# Altium project BMS-v1.1.PrjPcb (part 2 of 3)

## Sheet BMS-Controller-Sheet.SchDoc: Title
size 420 x 297 mm; Date: *******; ApprovedBy: *******; CheckedBy: None; Author: *******; CompanyName: *******; DrawnBy: Name; Engineer: *******; Organization: *******; Address1: *******; Address2: *******; Address3: *******; Address4: *******; DocumentNumber: Doc Num; Revision: *******; SheetNumber: 4; SheetTotal: 4; CurrentTime: *******; CurrentDate: *******; Time: *******; DocumentFullPathAndName: *******; DocumentName: *******; ModifiedDate: *******; ImagePath: *******; ProjectName: *******; Application_BuildNumber: *******
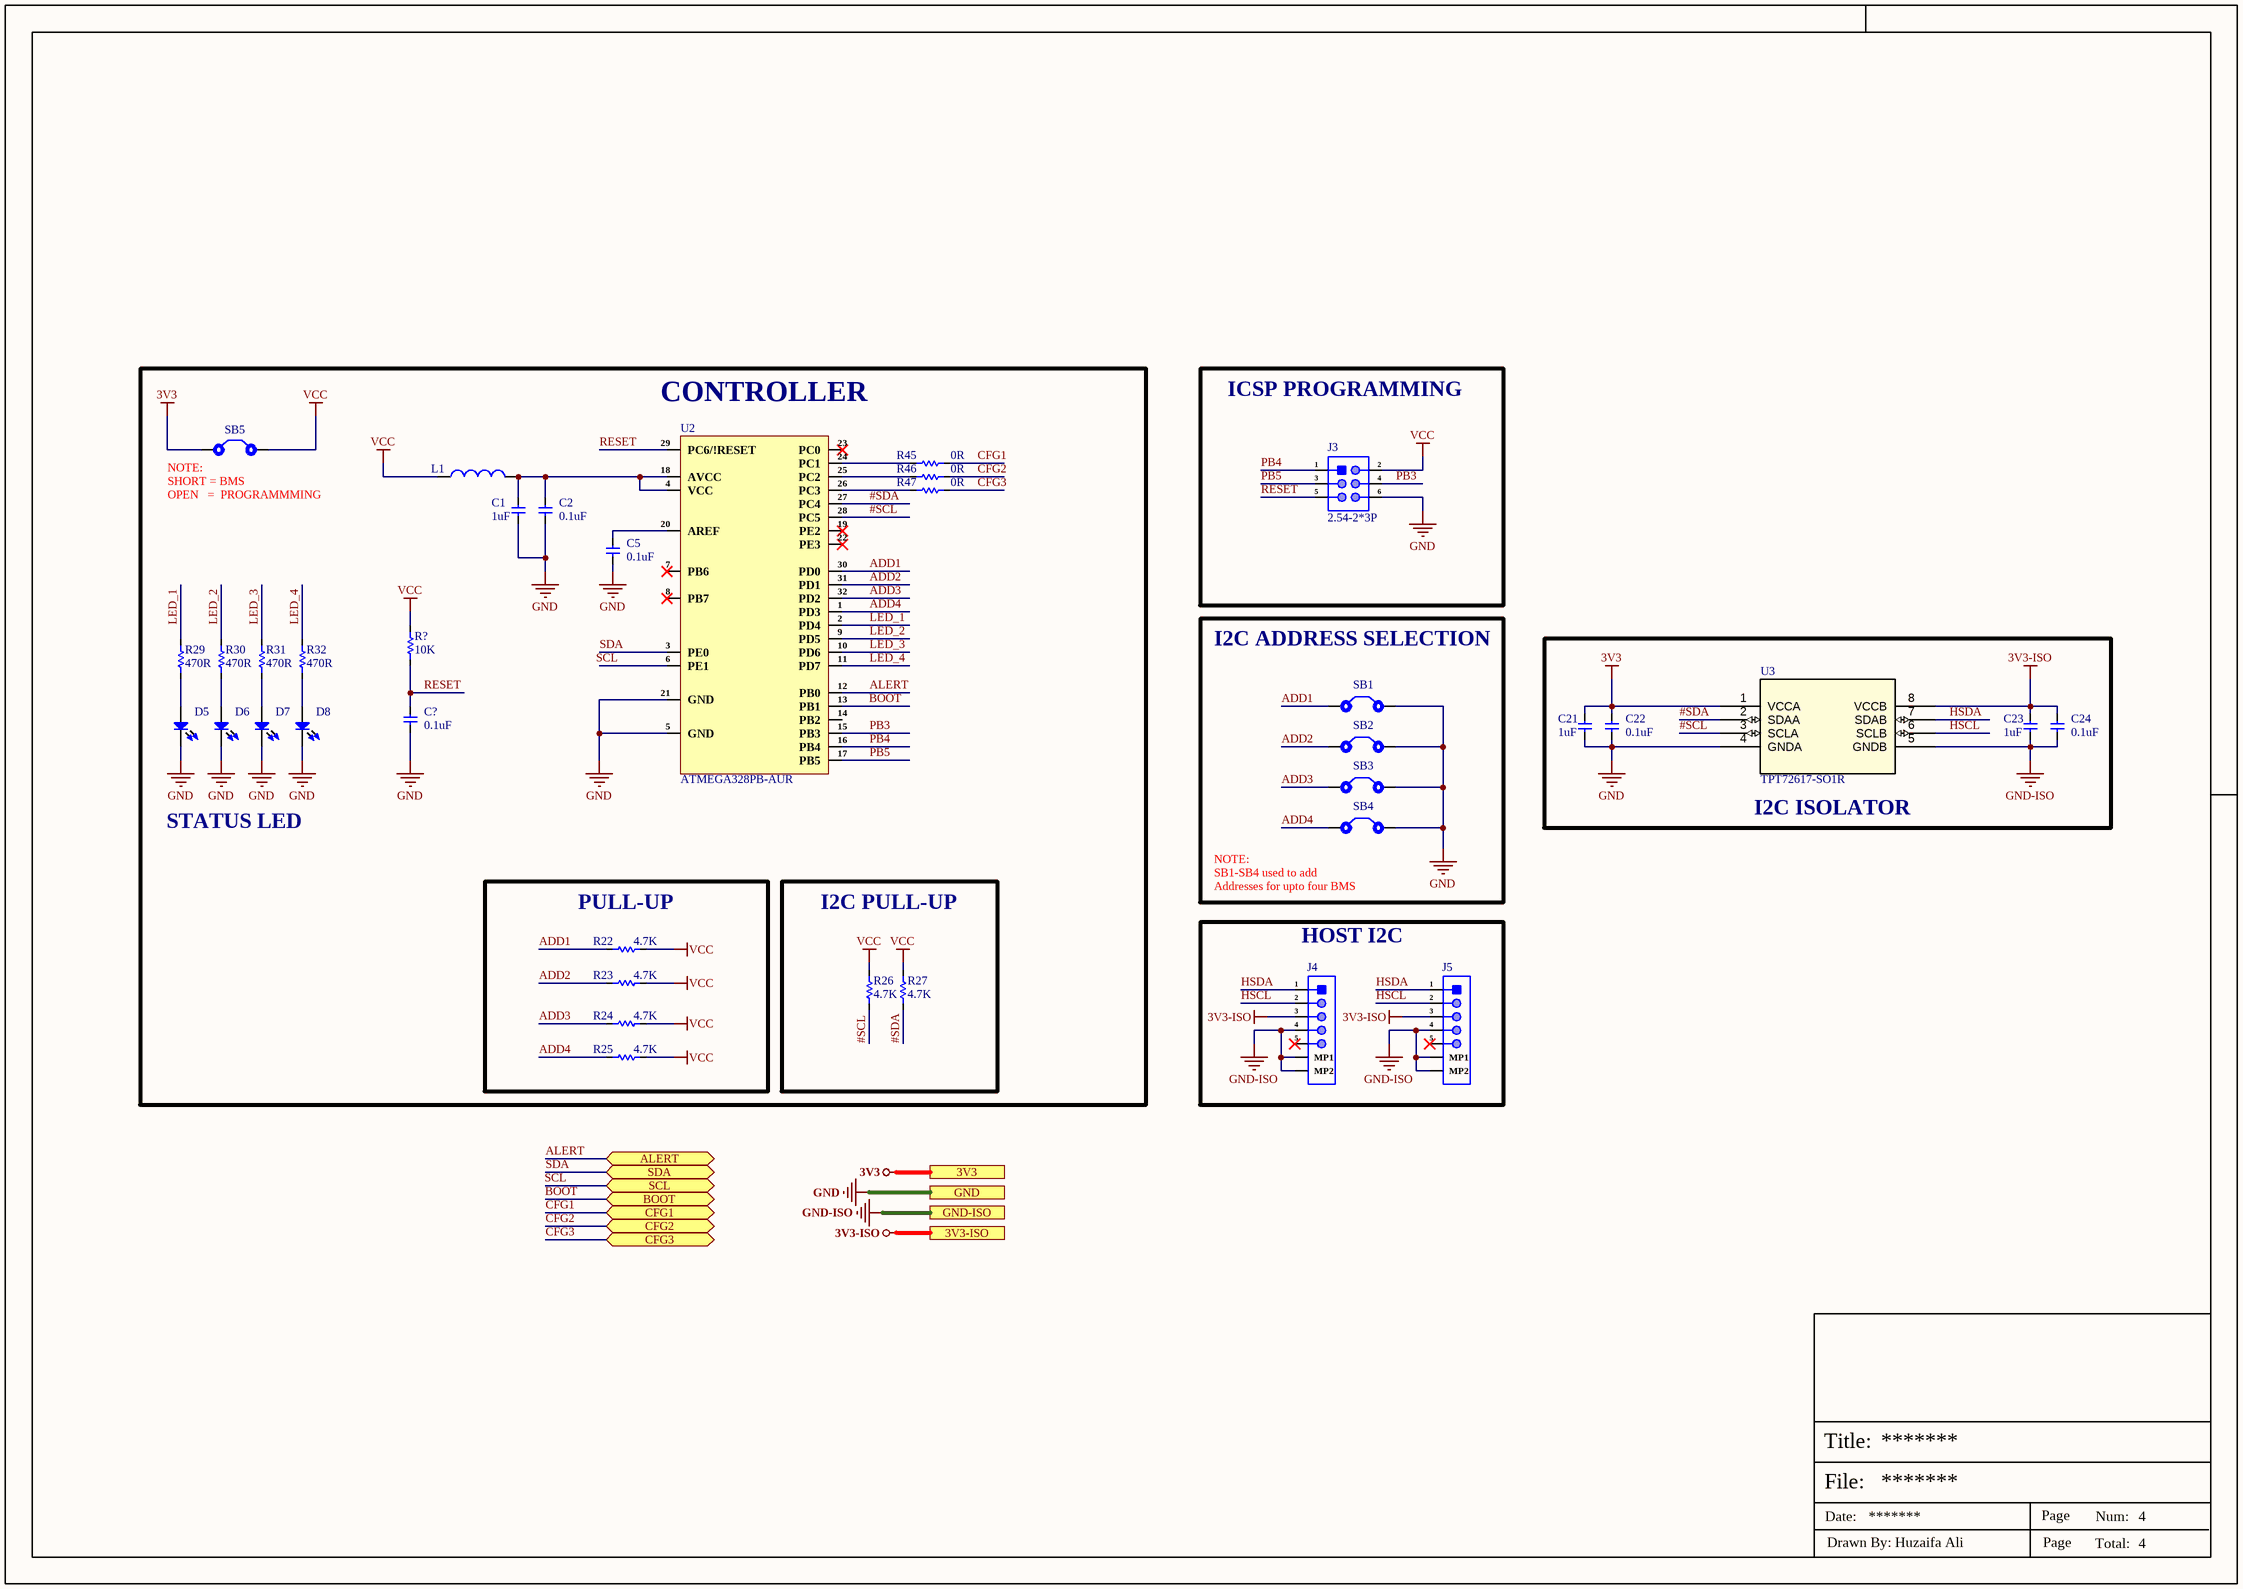
[diagram p2: BMS-Controller-Sheet.SchDoc]

### Parts
C1  1uF  [CAP-0201]
C2  0.1uF  [CAP-0201]
C5  0.1uF  [CAP-0201]
C21  1uF  [CAP-0201]
C22  0.1uF  [CAP-0201]
C23  1uF  [CAP-0201]
C24  0.1uF  [CAP-0201]
C?  0.1uF  [CAP-0201]
D5  QBLP617-IB  [LED-0603]  (value not drawn)
D6  QBLP617-IB  [LED-0603]  (value not drawn)
D7  QBLP617-IB  [LED-0603]  (value not drawn)
D8  QBLP617-IB  [LED-0603]  (value not drawn)
J3  2.54-2*3P  [2.54-2*3P]
J4  1.25-5PWB  [1.25-5PWB]  (value not drawn)
J5  1.25-5PWB  [1.25-5PWB]  (value not drawn)
L1  (no value)  [IND 0201]
R22  4.7K  [Res-0201]
R23  4.7K  [Res-0201]
R24  4.7K  [Res-0201]
R25  4.7K  [Res-0201]
R26  4.7K  [Res-0402]
R27  4.7K  [Res-0402]
R29  470R  [Res-0402]
R30  470R  [Res-0402]
R31  470R  [Res-0402]
R32  470R  [Res-0402]
R45  0R  [Res-0603]
R46  0R  [Res-0603]
R47  0R  [Res-0603]
R?  10K  [Res-0402]
SB1  Solder Bridge 0402  [Solder Bridge 0402]  (value not drawn)
SB2  Solder Bridge 0402  [Solder Bridge 0402]  (value not drawn)
SB3  Solder Bridge 0402  [Solder Bridge 0402]  (value not drawn)
SB4  Solder Bridge 0402  [Solder Bridge 0402]  (value not drawn)
SB5  Solder Bridge 0402  [Solder Bridge 0402]  (value not drawn)
U2  ATMEGA328PB-AUR  [32 TQFP (7x7)]
U3  TPT72617-SO1R  [SO1SOP-8-A_TPK]

### Blocks framed on the sheet
CONTROLLER: C1 C2 C5 C? D5-D8 L1 R29-R32 R45-R47 R? SB5 U2
ICSP PROGRAMMING: J3
I2C ADDRESS SELECTION: SB1-SB4
I2C ISOLATOR: C21-C24 U3
PULL-UP: R22-R25
I2C PULL-UP: R26 R27
HOST I2C: J4 J5

### Ports
3V3 (see Top-Sheet[3B], BATTERY_USB-Sheet[2C], BMS-Sheet[2D]), 3V3-ISO (see Top-Sheet[3C], BATTERY_USB-Sheet[2C]), ALERT (bidir, see Top-Sheet[3C], BMS-Sheet[1D]), BOOT (bidir, see Top-Sheet[3C], BMS-Sheet[1D]), CFG1 (bidir, see Top-Sheet[3C], BATTERY_USB-Sheet[1C]), CFG2 (bidir, see Top-Sheet[3C], BATTERY_USB-Sheet[1C]), CFG3 (bidir, see Top-Sheet[3C], BATTERY_USB-Sheet[1C]), GND (see Top-Sheet[3B], BATTERY_USB-Sheet[2C], BMS-Sheet[2D]), GND-ISO (see Top-Sheet[3C], BATTERY_USB-Sheet[2C]), SCL (bidir, see Top-Sheet[3C], BMS-Sheet[1D]), SDA (bidir, see Top-Sheet[3C], BMS-Sheet[1D])

### Nets
3V3: C21.1 C22.1 SB5.1 U3.1(VCCA) ; port 3V3
3V3-ISO: C23.1 C24.1 J4.3 J5.3 U3.8(VCCB) ; port 3V3-ISO
GND: C1.2 C2.2 C5.2 C21.2 C22.2 C?.2 D5.2 D6.2 D7.2 D8.2 J3.6 SB1.2 SB2.2 SB3.2 SB4.2 U2.5(GND) U2.21(GND) U3.4(GNDA) ; port GND
GND-ISO: C23.2 C24.2 J4.4 J4.MP1 J4.MP2 J5.4 J5.MP1 J5.MP2 U3.5(GNDB) ; port GND-ISO
VCC: J3.2 L1.1 R22.2 R23.2 R24.2 R25.2 R26.2 R27.2 R?.2 SB5.2
#SCL: R26.1 U2.28(PC5) U3.3(SCLA)
#SDA: R27.1 U2.27(PC4) U3.2(SDAA)
ADD1: R22.1 SB1.1 U2.30(PD0)
ADD2: R23.1 SB2.1 U2.31(PD1)
ADD3: R24.1 SB3.1 U2.32(PD2)
ADD4: R25.1 SB4.1 U2.1(PD3)
ALERT: U2.12(PB0) ; port ALERT
BOOT: U2.13(PB1) ; port BOOT
CFG1: R45.2 ; port CFG1
CFG2: R46.2 ; port CFG2
CFG3: R47.2 ; port CFG3
HSCL: J4.2 J5.2 U3.6(SCLB)
HSDA: J4.1 J5.1 U3.7(SDAB)
LED_1: R29.2 U2.2(PD4)
LED_2: R30.2 U2.9(PD5)
LED_3: R31.2 U2.10(PD6)
LED_4: R32.2 U2.11(PD7)
PB3: J3.4 U2.15(PB3)
PB4: J3.1 U2.16(PB4)
PB5: J3.3 U2.17(PB5)
RESET: C?.1 J3.5 R?.1 U2.29(PC6/!RESET)
SCL: U2.6(PE1) ; port SCL
SDA: U2.3(PE0) ; port SDA
NetC1_1: C1.1 C2.1 L1.2 U2.4(VCC) U2.18(AVCC)
NetC5_1: C5.1 U2.20(AREF)
NetD5_1: D5.1 R29.1
NetD6_1: D6.1 R30.1
NetD7_1: D7.1 R31.1
NetD8_1: D8.1 R32.1
NetR45_1: R45.1 U2.24(PC1)
NetR46_1: R46.1 U2.25(PC2)
NetR47_1: R47.1 U2.26(PC3)

Not connected (* = marked no-connect by the designer): J4 5*; J5 5*; U2 7(PB6)* 8(PB7)* 14(PB2) 19(PE2)* 22(PE3)* 23(PC0)*

### Notes on the sheet
- (near SB5) SHORT = BMS
  OPEN   =  PROGRAMMMING
- (near SB5) NOTE:
- STATUS LED
- NOTE:
- (near SB4) SB1-SB4 used to add Addresses for upto four BMS
- File:
- Title:
- Date:
- Page
- Num:
- Total:
- Drawn By: Huzaifa Ali

### Library data of the parts
C1 C21 C23 = CC0201MRX5R7BB105: CAP CER 1UF 16V X5R 0201; Manufacturer: Yageo; Item Type: Capacitor; Manufacturer Part Number: CC0201MRX5R7BB105; Supplier: Digi-Key; Supplier Part Number: 13-CC0201MRX5R7BB105TR-ND; RoHS: Yes; Category: Ceramic Capacitors; LCSC Part Number: C5182464
C2 C5 C22 C24 C? = GRM033C81E104KE14D: CAP CER 0.1UF 25V X6S 0201; Manufacturer: Murata; Capacitance: 100nF; Tolerance: 10%; Supplier 1: Digi-Key; Manufacturer Part Number: GRM033C81E104KE14D; Stock 1: 91; Pricing 1: 1=0.10000, 10=0.05100, 50=0.02780, 100=0.02260, 500=0.01616, 1000=0.01270, 2500=0.01155, 5000=0.01063 (USD); Mount: Surface Mount; Case/Package: 0201; Min Operating Temperature: -55°C; Max Operating Temperature: 105°C; Dielectric: X6S; Voltage Rating: 25V; Package Quantity: 15000; Packaging: Tape and Reel; Voltage Rating (DC): 25V; Length: 0.024inch; Height: 0.3mm; Width: 0.3mm; Thickness: 0.013inch; ComponentLink1URL: http://www.mouser.com/ds/2/281/c02e-2905.pdf?src-supplier=Mouser; ComponentLink1Description: http://www.mouser.com/ds/2/281/c02e-2905.pdf?src-supplier=Mouser; ComponentLink2URL: http://www.farnell.com/datasheets/2722733.pdf?src-supplier=Farnell; ComponentLink2Description: http://www.farnell.com/datasheets/2722733.pdf?src-supplier=Farnell; Supplier Part Number 1: 490-10403-1-ND; RoHS Compliant: Yes; RoHS: Yes; Category: Ceramic Capacitors; Case Code (Metric): 0603; Case Code (Imperial): 0201; Weight: 1.2E-05oz; Termination: SMD/SMT; ComponentLink3URL: http://search.murata.co.jp/Ceramy/image/img/A01X/G101/ENG/GRM033C81E104KE14-01.pdf?src-supplier=Digi-Key; ComponentLink3Description: http://search.murata.co.jp/Ceramy/image/img/A01X/G101/ENG/GRM033C81E104KE14-01.pdf?src-supplier=Digi-Key
D5-D8 = QBLP617-IB: LED BLUE CLEAR 0602 SMD R/A; Manufacturer: QT Brightek; Item Type: LEDs; Forward Current: 20mA; Forward Voltage: 3.1V; Luminous Intensity: 63mcd; Number of Circuits: 1; Power Dissipation: 111mW; Reverse Voltage: 5V; Shape: Rectangular; Viewing Angle: 140°; Wavelength: 470nm; Supplier: Arrow Electronics; Supplier Part Number: QBLP617-IB; Manufacturer Part Number: QBLP617-IB; RoHS: Compliant; Stock: 1867; Pricing: 1=0.0007 (USD); Case/Package: 0602; Color: Blue; Height: 600µm; Max Operating Temperature: 80°C; Min Operating Temperature: -40°C; Mounting Technology: Surface Mount; Number of Terminals: 2; REACH SVHC: Yes; Schedule B: 8541402000, 8541402000|8541402000|8541402000|8541402000|8541402000, 8541410000; Terminal Pitch: 2.1mm; ComponentLink1URL: https://datasheet.octopart.com:443/QBLP617-IB-QT-Brightek-datasheet-140961254.pdf?src-supplier=IHS; ComponentLink1Description: https://datasheet.octopart.com:443/QBLP617-IB-QT-Brightek-datasheet-140961254.pdf?src-supplier=IHS
J3 = 2.54-2*3P: Straight 6P 2.54mm 双排 Black Plugin,P=2.54mm Pin Headers ROHS; Manufacturer: BOOMELE(BOOM Precision Elec); Item Type: Male; Manufacturer Part Number: 2.54-2*3P; Package: SMD,P=2.54mm; LCSC Part Number: C65114; ComponentLink1Description: LCSC; ComponentLink1URL: https://www.lcsc.com/product-detail/Pin-Headers_BOOMELE-Boom-Precision-Elec-2-54-2-3P_C65114.html
J4 J5 = 1.25-5PWB: 1x5P 1 1.25mm Male pin 5 -25℃~+85℃ Surface Mount SMD,P=1.25mm Wire To Board / Wire To Wire Connector ROHS; Manufacturer: DEALON; Item Type: JST Right Angle; Manufacturer Part Number: 1.25-5PWB; Package: SMD,P=1.25mm; LCSC Part Number: C2905012; ComponentLink1Description: LCSC; ComponentLink1URL: https://www.lcsc.com/product-detail/Wire-To-Board-Wire-To-Wire-Connector_DEALON-1-25-5PWB_C2905012.html
L1 = MMZ0603S601CT000: FERRITE BEAD 600 OHM 0201 1LN; Manufacturer: TDK; Impedance: 600R; Tolerance: 25%; DC Resistance (DCR): 1.45R; Max DC Current: 100mA; Supplier 1: Digi-Key; Manufacturer Part Number: MMZ0603S601CT000; RoHS: Yes; Category: Inductors; Stock 1: 1540; Pricing 1: 1=0.12000, 10=0.09900, 25=0.07680, 50=0.06380, 100=0.05500, 250=0.04400, 500=0.03960, 1000=0.03300, 5000=0.03080 (USD); Mount: Surface Mount; Case/Package: 0201; Core Material: Ferrite; Case Code (Metric): 0603; Case Code (Imperial): 0201; Packaging: Cut Tape; Package Quantity: 15000; Current Rating: 100mA; Length: 0.024inch; Width: 0.012inch; Height: 0.013inch; REACH SVHC: No SVHC; Lead Free: Lead Free; RoHS Compliant: Yes; ComponentLink1URL: https://datasheet.ciiva.com/46381/1795294-46381669.pdf?src-supplier=Element14; ComponentLink1Description: https://datasheet.ciiva.com/46381/1795294-46381669.pdf?src-supplier=Element14; ComponentLink2URL: https://datasheet.ciiva.com/46634/beads-commercial-signal-mmz-en-46634390.pdf?src-supplier=Digi-Key; ComponentLink2Description: https://datasheet.ciiva.com/46634/beads-commercial-signal-mmz-en-46634390.pdf?src-supplier=Digi-Key; ComponentLink3URL: https://datasheet.ciiva.com/48682/beads-commercial-signal-mmz-en-48682603.pdf?src-supplier=Avnet; ComponentLink3Description: https://datasheet.ciiva.com/48682/beads-commercial-signal-mmz-en-48682603.pdf?src-supplier=Avnet; ComponentLink4URL: https://datasheet.ciiva.com/46634/beads-commercial-signal-mmz-en-46634381.pdf?src-supplier=Digi-Key; ComponentLink4Description: https://datasheet.ciiva.com/46634/beads-commercial-signal-mmz-en-46634381.pdf?src-supplier=Digi-Key; Supplier Part Number 1: 445-2146-1-ND
R22-R25 = RC0201FR-074K7L: RES 4.7K OHM 1% 1/20W 0201; Manufacturer: Yageo; Item Type: Resistor; Manufacturer Part Number: RC0201FR-074K7L; RoHS: Yes; Category: Chip SMD Resistors; ComponentLink1URL: https://datasheet.ciiva.com/2493/pyu-r-int-thick-7-2493811.pdf?src-supplier=Digi-Key; ComponentLink1Description: https://datasheet.ciiva.com/2493/pyu-r-int-thick-7-2493811.pdf?src-supplier=Digi-Key; ComponentLink2URL: https://datasheet.ciiva.com/2493/pyu-r-int-thick-7-2493812.pdf?src-supplier=Digi-Key; ComponentLink2Description: https://datasheet.ciiva.com/2493/pyu-r-int-thick-7-2493812.pdf?src-supplier=Digi-Key; ComponentLink3URL: https://datasheet.ciiva.com/2493/pyu-r-int-thick-7-2493813.pdf?src-supplier=Digi-Key; ComponentLink3Description: https://datasheet.ciiva.com/2493/pyu-r-int-thick-7-2493813.pdf?src-supplier=Digi-Key; ComponentLink4URL: https://datasheet.ciiva.com/8892/pyu-rc0201-51-rohs-l-8-8892942.pdf?src-supplier=Avnet; ComponentLink4Description: https://datasheet.ciiva.com/8892/pyu-rc0201-51-rohs-l-8-8892942.pdf?src-supplier=Avnet; ComponentLink5URL: https://datasheet.ciiva.com/7672/1563626-7672233.pdf?src-supplier=Element14; ComponentLink5Description: https://datasheet.ciiva.com/7672/1563626-7672233.pdf?src-supplier=Element14; LCSC Part Number: C138135; Supplier: Future Electronics; Supplier Part Number: 7537285; Stock: 1610000; Pricing: 10000=0.0014, 50000=0.0013, 250000=0.0013, 750000=0.0012, 2000000=0.0011 (USD)
R26 R27 = RC0402FR-074K7L: RES 4.7K OHM 1% 1/16W 0402; Manufacturer: Yageo; Resistance: 4.7kR; Temperature Coefficient: 100ppm/°C; Voltage Rating (DC): 50V; Power Rating: 62.5mW; Max Power Dissipation: 63mW; Item Type: Resistor; Supplier 1: Avnet; Manufacturer Part Number: RC0402FR-074K7L; RoHS: Yes; Category: Chip SMD Resistors; Stock 1: 2420000; Pricing 1: 10000=0.00085 (USD); Case/Package: 0402; Number of Pins: 2; Case Code (Imperial): 0402; Case Code (Metric): 1005; Min Operating Temperature: -55°C; Max Operating Temperature: 155°C; Tolerance: 1%; Resistor Type: Thick Film; Packaging: Tape and Reel; Voltage Rating: 50V; Termination: SMD/SMT; Features: Moisture Resistant; Series: RC; Number of Terminations: 2; Resistance Tolerance: 1%; Construction: Rectangular; Length: 1mm; Width: 0.5mm; Height: 0.32mm; Depth: 0.5mm; Lead Free: Lead Free; Military Standard: Not; RoHS Compliant: Yes; ComponentLink1URL: https://datasheet.ciiva.com/22661/1686128-22661342.pdf?src-supplier=Element14; ComponentLink1Description: https://datasheet.ciiva.com/22661/1686128-22661342.pdf?src-supplier=Element14; ComponentLink2URL: https://datasheet.ciiva.com/7850/1018594-7850022.pdf?src-supplier=Element14; ComponentLink2Description: https://datasheet.ciiva.com/7850/1018594-7850022.pdf?src-supplier=Element14; ComponentLink3URL: https://datasheet.ciiva.com/7850/1018594-7850023.pdf?src-supplier=Element14; ComponentLink3Description: https://datasheet.ciiva.com/7850/1018594-7850023.pdf?src-supplier=Element14; ComponentLink4URL: https://datasheet.ciiva.com/15215/getdatasheetpartid-328119-15215035.pdf?src-supplier=Verical; ComponentLink4Description: https://datasheet.ciiva.com/15215/getdatasheetpartid-328119-15215035.pdf?src-supplier=Verical; Supplier Part Number 1: RC0402FR-074K7L; LCSC Part Number: C105871; Size Code: 0402; Height - Seated (Max): 0.016inch; Reach SVHC Compliant: Yes
R29-R32 = RC0402FR-07470RL: RES 470 OHM 1% 1/16W 0402; Manufacturer: Yageo; Item Type: Resistor; Voltage Rating: 50V; Power Rating: 62.5mW; Temperature Coefficient: 100ppm/°C; Max Power Dissipation: 63mW; Supplier: Avnet; Supplier Part Number: RC0402FR-07470RL; Manufacturer Part Number: RC0402FR-07470RL; RoHS: Yes; Stock: 10000; Pricing: 10000=0.00085 (USD); Case/Package: 0402; Case Code (Metric): 1005; Case Code (Imperial): 0402; Min Operating Temperature: -55°C; Max Operating Temperature: 155°C; Packaging: Tape and Reel; Value: 470R; Tolerance: 1%; Number of Terminations: 2; Working Voltage: 50V; Package Quantity: 1; Resistor Type: Thick Film; Termination: SMD/SMT; Features: Moisture Resistant; Series: RC; Resistance Tolerance: 1%; Construction: Rectangular; Voltage Rating (AC): 50V; Length: 1mm; Width: 0.02inch; Height: 0.016inch; Depth: 0.5mm; Lead Free: Lead Free; Reach SVHC Compliant: No; RoHS Compliant: Yes; Military Standard: Not; ComponentLink1URL: https://datasheet.ciiva.com/46412/1018594-46412838.pdf?src-supplier=Element14; ComponentLink1Description: https://datasheet.ciiva.com/46412/1018594-46412838.pdf?src-supplier=Element14; ComponentLink2URL: https://datasheet.ciiva.com/2453/pyu-r-int-thick-7-2453377.pdf?src-supplier=Digikey; ComponentLink2Description: https://datasheet.ciiva.com/2453/pyu-r-int-thick-7-2453377.pdf?src-supplier=Digikey; ComponentLink3URL: https://datasheet.ciiva.com/2453/pyu-r-int-thick-7-2453378.pdf?src-supplier=Digikey; ComponentLink3Description: https://datasheet.ciiva.com/2453/pyu-r-int-thick-7-2453378.pdf?src-supplier=Digikey; ComponentLink4URL: https://datasheet.ciiva.com/2453/pyu-r-int-thick-7-2453376.pdf?src-supplier=Digikey; ComponentLink4Description: https://datasheet.ciiva.com/2453/pyu-r-int-thick-7-2453376.pdf?src-supplier=Digikey; ComponentLink5URL: https://datasheet.ciiva.com/7850/1018594-7850015.pdf?src-supplier=Element14; ComponentLink5Description: https://datasheet.ciiva.com/7850/1018594-7850015.pdf?src-supplier=Element14; ComponentLink6URL: https://datasheet.ciiva.com/7850/1018594-7850014.pdf?src-supplier=Element14; ComponentLink6Description: https://datasheet.ciiva.com/7850/1018594-7850014.pdf?src-supplier=Element14; ComponentLink7URL: https://datasheet.ciiva.com/15189/getdatasheetpartid-330246-15189463.pdf?src-supplier=Verical; ComponentLink7Description: https://datasheet.ciiva.com/15189/getdatasheetpartid-330246-15189463.pdf?src-supplier=Verical; LCSC Part Number: C114877
R45-R47 = RC0603JR-070RL: RES 0 OHM JUMPER 1/10W 0603; Manufacturer: Yageo; Resistance: 0mR; Tolerance: 1%; Power Rating: 100mW; Voltage Rating (DC): 50V; Temperature Coefficient: 200ppm/°C; Resistance Tolerance: 5%; Item Type: Resistor; Supplier 1: Digi-Key; Manufacturer Part Number: RC0603JR-070RL; RoHS: Yes; Category: Chip SMD Resistors; Stock 1: 18081776; Pricing 1: 1=0.10000, 10=0.01700, 25=0.01240, 50=0.00960, 100=0.00700, 250=0.00536, 500=0.00430, 1000=0.00316 (USD); Case/Package: 0603; Number of Pins: 2; Contact Plating: Tin,Matte; Case Code (Imperial): 0603; Case Code (Metric): 1608; Size Code: 0603; Min Operating Temperature: -55°C; Max Operating Temperature: 155°C; Resistor Type: Thick Film; Packaging: Tape and Reel; Termination: SMD/SMT; Series: RC; Technology: THICK FILM; Package Quantity: 5000; Voltage Rating: 50V; Features: Moisture Resistant; Max Power Dissipation: 100mW; Number of Terminations: 2; Construction: Rectangular; Length: 1.6mm; Width: 0.8mm; Height: 0.45mm; Depth: 0.8mm; Radiation Hardening: No; Reach SVHC Compliant: No SVHC; Lead Free: Lead Free; RoHS Compliant: Yes; Military Standard: Not; Supplier Part Number 1: 311-0.0GRCT-ND; LCSC Part Number: C95177
R? = SR0402FR-7T10KL: RES 10K OHM 1% 1/5W 0402; Manufacturer: Yageo; Supplier 1: Digi-Key; Manufacturer Part Number: SR0402FR-7T10KL; Stock 1: 7859; Pricing 1: 1=0.56, 10=0.398, 100=0.2072, 1000=0.11156, 2500=0.10757, 5000=0.10598 (USD); RoHS Compliant: Yes; ComponentLink1URL: http://www.yageo.com/documents/recent/PYu-SR_D_F%20tol_RoHS_L_3.pdf?src-supplier=Digi-Key; ComponentLink1Description: http://www.yageo.com/documents/recent/PYu-SR_D_F%20tol_RoHS_L_3.pdf?src-supplier=Digi-Key; Supplier Part Number 1: YAG5815CT-ND; LCSC Part Number: C854480
SB1-SB5 = Solder Bridge 0402: Solder Bridge ON; Manufacturer Part Number: Solder Bridge 0402; Item Type: Solder Bridge
U2 = ATMEGA328PB-AUR: IC MCU 8BIT 32KB FLASH 32TQFP; Manufacturer: Microchip; Number of A/D Converters: 1NUMBER; Number of ADC Channels: 8NUMBER; Number of I2C Channels: 2NUMBER; Number of PWM Channels: 10NUMBER; Supplier: Digikey; Supplier Part Number: ATMEGA328PB-AURCT-ND; Manufacturer Part Number: ATMEGA328PB-AUR; RoHS: No; Category: Microcontrollers; Stock: 17600; Pricing: 1=1.7, 25=1.56, 100=1.41 (USD); Number of SPI Channels: 2NUMBER; Number of UART Channels: 2NUMBER; Height: 1.2mm; ComponentLink1URL: http://www.atmel.com/images/atmel-42397-8-bit-avr-microcontroller-atmega328pb_summary.pdf?src-supplier=Avnet; ComponentLink1Description: http://www.atmel.com/images/atmel-42397-8-bit-avr-microcontroller-atmega328pb_summary.pdf?src-supplier=Avnet; ComponentLink2URL: http://www.microchip.com/mymicrochip/filehandler.aspx?ddocname=en589666&src-supplier=Digikey; ComponentLink2Description: http://www.microchip.com/mymicrochip/filehandler.aspx?ddocname=en589666&src-supplier=Digikey; ComponentLink3URL: https://datasheet.octopart.com/ATMEGA328PB-AUR-Microchip-datasheet-154741725.pdf?src-supplier=Electro+Sonic; ComponentLink3Description: https://datasheet.octopart.com/ATMEGA328PB-AUR-Microchip-datasheet-154741725.pdf?src-supplier=Electro+Sonic; ComponentLink4URL: https://datasheet.octopart.com/ATMEGA328PB-AUR-Microchip-datasheet-136376163.pdf?src-supplier=SHENGYU+ELECTRONICS; ComponentLink4Description: https://datasheet.octopart.com/ATMEGA328PB-AUR-Microchip-datasheet-136376163.pdf?src-supplier=SHENGYU+ELECTRONICS
U3 = TPT72617-SO1R: Description; Manufacturer_Name: 3Peak; Copyright: Copyright (C) 2025 Ultra Librarian. All rights reserved.; Manufacturer_Part_Number: TPT72617-SO1R; RefDes: RefDes; Type: Type

## Sheet BATTERY_USB-Sheet.SchDoc
size 420 x 297 mm; SheetNumber: 2; SheetTotal: 4
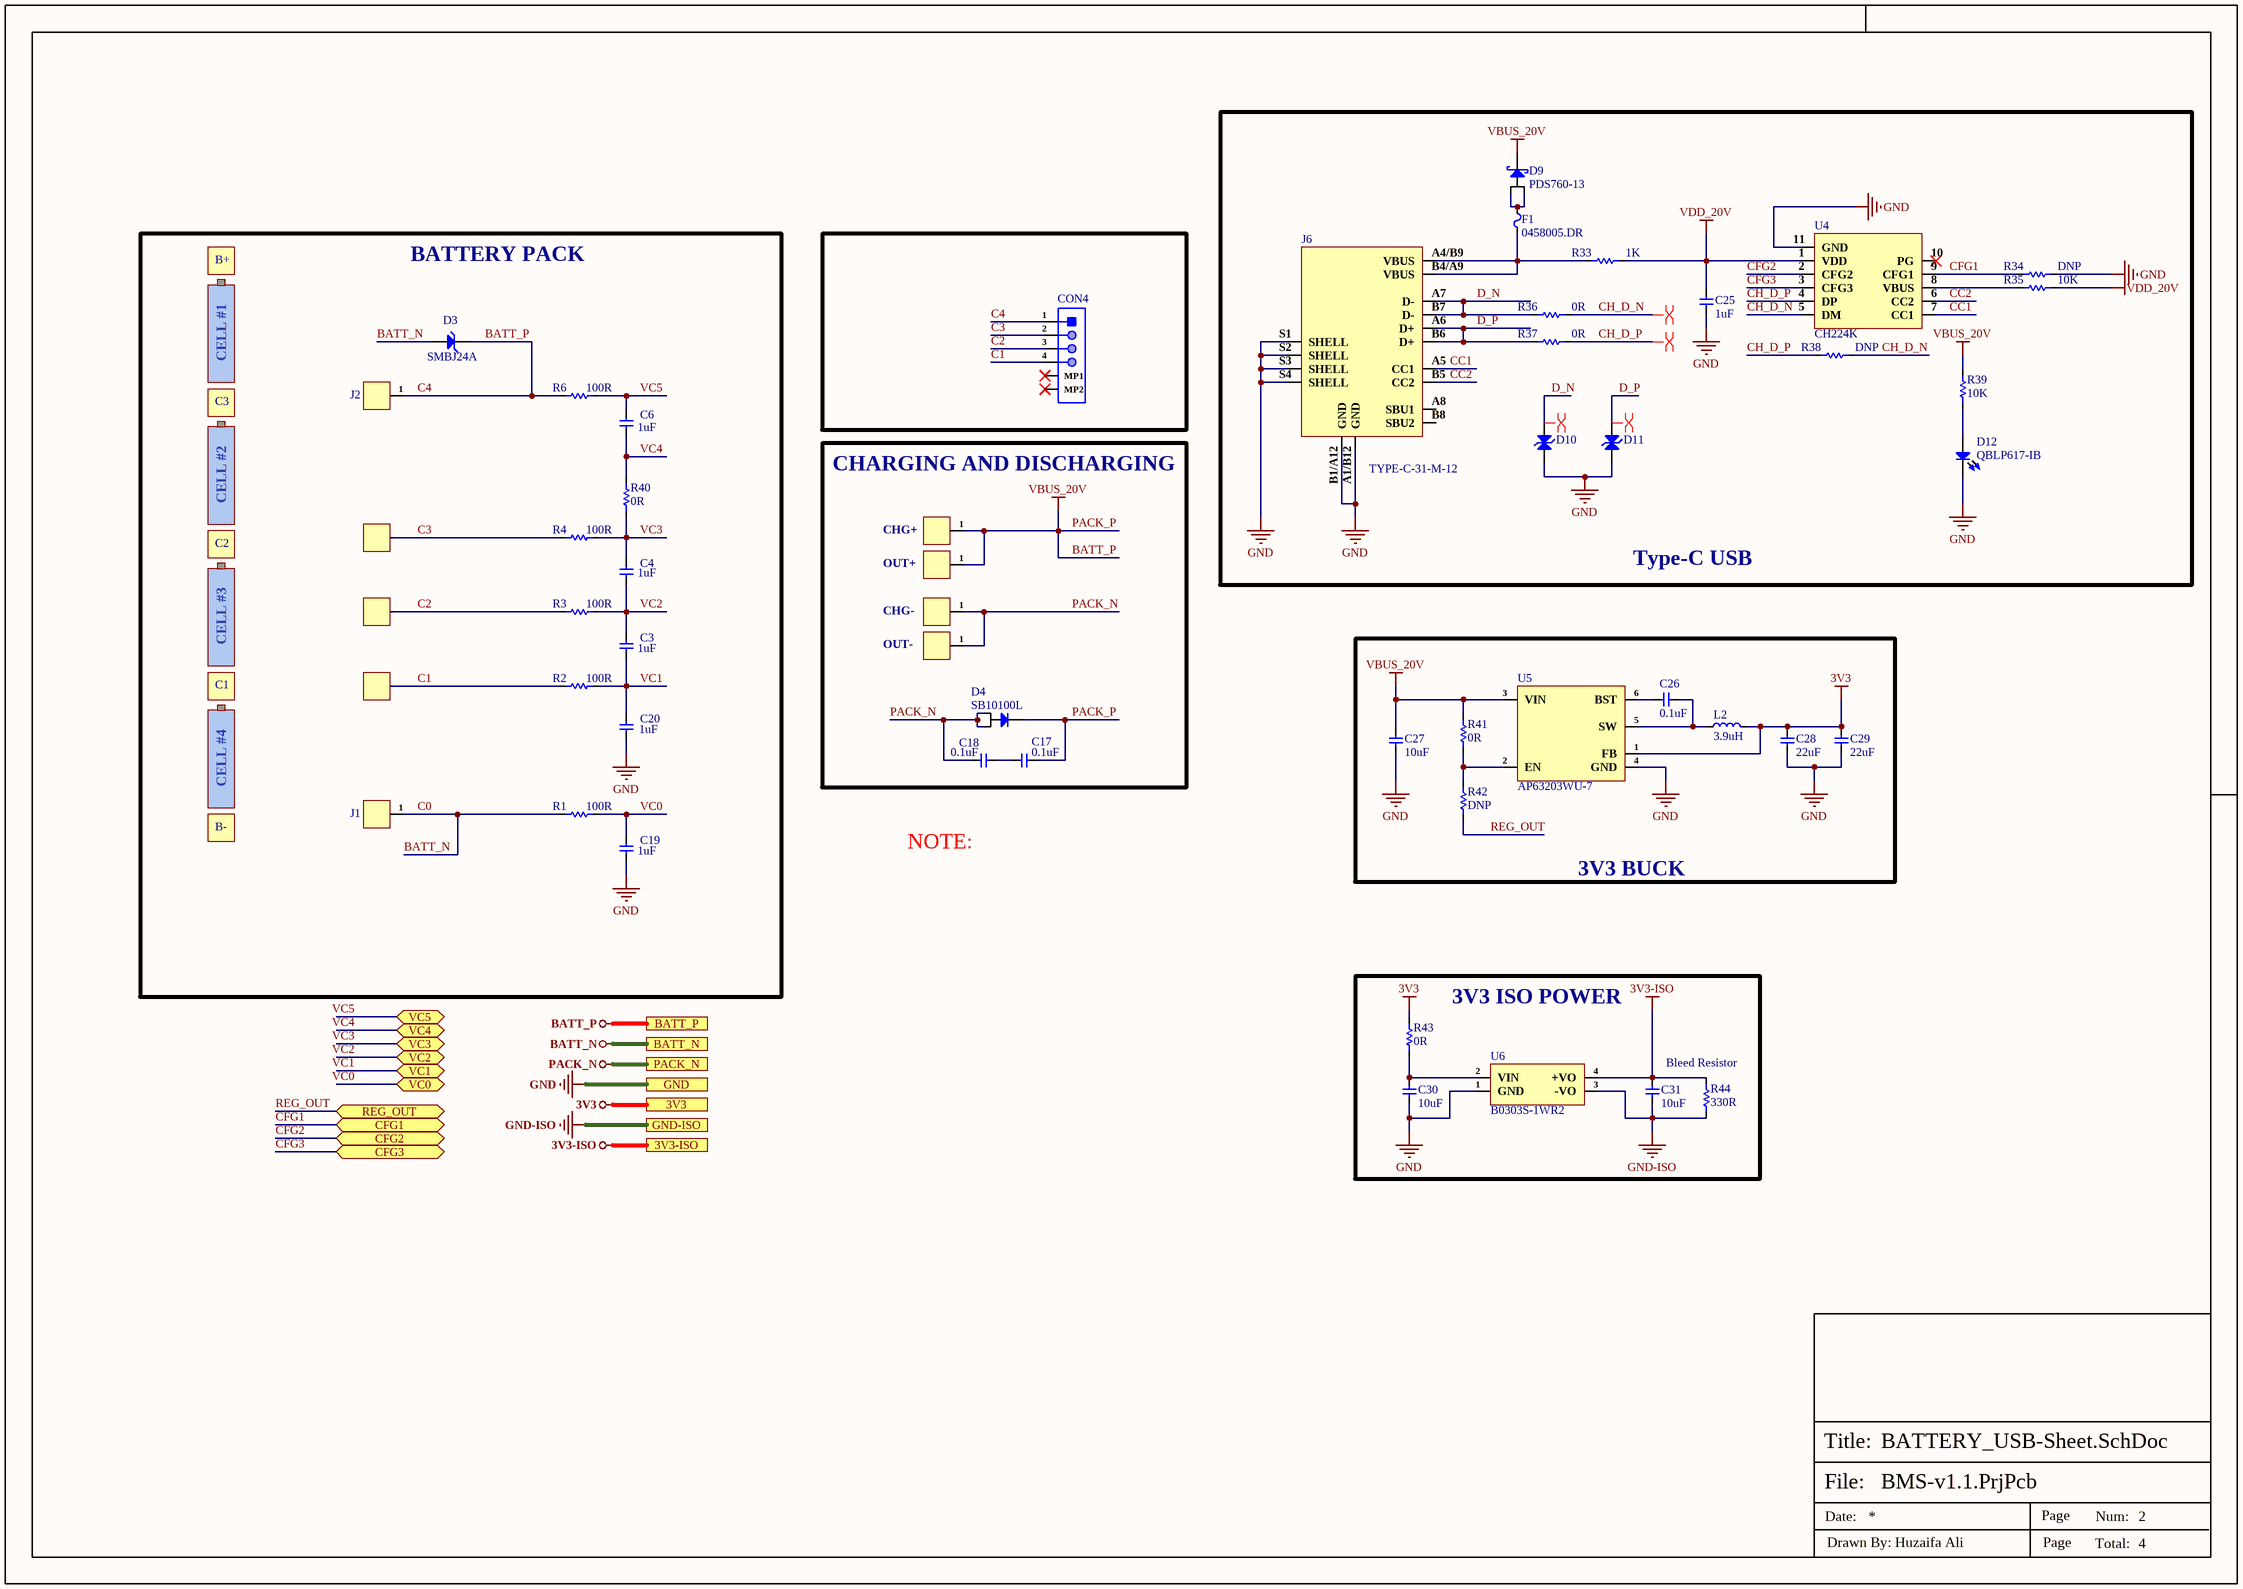
[diagram p3: BATTERY_USB-Sheet.SchDoc]

### Parts
C3  1uF  [Cap-0402]
C4  1uF  [Cap-0402]
C6  1uF  [Cap-0402]
C17  0.1uF  [CAP-0603]
C18  0.1uF  [CAP-0603]
C19  1uF  [Cap-0402]
C20  1uF  [Cap-0402]
C25  1uF  [Cap-0805]
C26  0.1uF  [Cap-0603]
C27  10uF  [Cap-1210]
C28  22uF  [Cap-0805]
C29  22uF  [Cap-0805]
C30  10uF  [Cap-1210]
C31  10uF  [Cap-1210]
CON4  S4B-ZR-SM4A-TF(LF)(SN)  [S4B-ZR-SM4A-TF(LF)(SN)]  (value not drawn)
D3  SMBJ24A  [SMB_]
D4  SB10100L  [SB10100L]
D9  PDS760-13  [Power-DI-5]
D10  ESD5B5.0ST1G  [SOD-523 (Bi-Directional)]  (value not drawn)
D11  ESD5B5.0ST1G  [SOD-523 (Bi-Directional)]  (value not drawn)
D12  QBLP617-IB  [LED-0603]
F1  0458005.DR  [Fuse 1206 (3216 Metric)]
J1  Through_Hole_Pad  [Through Hole Pad (High Power)_]  (value not drawn)
J2  Through_Hole_Pad  [Through Hole Pad (High Power)_]  (value not drawn)
J6  TYPE-C-31-M-12  [TYPE-C-31-M-12_]
J7  Through_Hole_Pad  [Through Hole Pad (High Power)_]  (value not drawn)
J8  Through_Hole_Pad  [Through Hole Pad (High Power)_]  (value not drawn)
J9  Through_Hole_Pad  [Through Hole Pad (High Power)_]  (value not drawn)
J10  Through_Hole_Pad  [Through Hole Pad (High Power)_]  (value not drawn)
L2  3.9uH  [FNR4030S3R9MT]
R1  100R  [RES-0805]
R2  100R  [RES-0805]
R3  100R  [RES-0805]
R4  100R  [RES-0805]
R6  100R  [RES-0805]
R33  1K  [Res-0603]
R34  DNP  [Res-0603]
R35  10K  [Res-0603]
R36  0R  [Res-0603]
R37  0R  [Res-0603]
R38  DNP  [Res-0603]
R39  10K  [Res-0603]
R40  0R  [Res-0603]
R41  0R  [Res-0603]
R42  DNP  [Res-0603]
R43  0R  [Res-0603]
R44  330R  [Res-0402]
U4  CH224K  [ESSOP-10-150mil-1mm]
U5  AP63203WU-7  [TSOT-23-6]
U6  B0303S-1WR2  [B0303S-1WR2]

### Blocks framed on the sheet
Type-C USB: C25 D9-D12 F1 J6 R33-R39 U4
BATTERY PACK: C3 C4 C6 C19 C20 D3 J1 J2 R1-R4 R6 R40
CHARGING AND DISCHARGING: C17 C18 D4 J7-J10
3V3 BUCK: C26-C29 L2 R41 R42 U5
3V3 ISO POWER: C30 C31 R43 R44 U6

### Ports
3V3 (see Top-Sheet[2B], BMS-Controller-Sheet[3C], BMS-Sheet[2D]), 3V3-ISO (see Top-Sheet[1B], BMS-Controller-Sheet[3D]), BATT_N (see Top-Sheet[2C], BMS-Sheet[2D]), BATT_P (see Top-Sheet[2C], BMS-Sheet[2D]), CFG1 (bidir, see Top-Sheet[1C], BMS-Controller-Sheet[2D]), CFG2 (bidir, see Top-Sheet[1C], BMS-Controller-Sheet[2D]), CFG3 (bidir, see Top-Sheet[1C], BMS-Controller-Sheet[2D]), GND (see Top-Sheet[2B], BMS-Controller-Sheet[3D], BMS-Sheet[2D]), GND-ISO (see Top-Sheet[1B], BMS-Controller-Sheet[3D]), PACK_N (see Top-Sheet[2C], BMS-Sheet[2D]), REG_OUT (bidir, see Top-Sheet[2C], BMS-Sheet[1D]), VC0 (bidir, see Top-Sheet[2C], BMS-Sheet[2D]), VC1 (bidir, see Top-Sheet[2C], BMS-Sheet[2D]), VC2 (bidir, see Top-Sheet[2C], BMS-Sheet[2D]), VC3 (bidir, see Top-Sheet[2C], BMS-Sheet[2D]), VC4 (bidir, see Top-Sheet[2B], BMS-Sheet[2D]), VC5 (bidir, see Top-Sheet[2B], BMS-Sheet[2D])

### Nets
3V3: C28.2 C29.2 L2.2 R43.2 U5.1(FB) ; port 3V3
3V3-ISO: C31.2 R44.2 U6.4(+VO) ; port 3V3-ISO
BATT_N: D3.1(A) J1.1 R1.1 ; port BATT_N  [also labelled C0]
BATT_P: C17.2 C27.2 CON4.1 D3.2(K) D4.3(K) D9.3(K) J2.1 J7.1 J8.1 R6.1 R39.2 R41.2 U5.3(VIN) ; port BATT_P  [also labelled C4, PACK_P, VBUS_20V]
GND: C19.1 C20.1 C25.1 C27.1 C28.1 C29.1 C30.1 D10.1(A) D11.1(A) D12.2 J6.A1/B12(GND) J6.B1/A12(GND) J6.S1(SHELL) J6.S2(SHELL) J6.S3(SHELL) J6.S4(SHELL) R34.2 U4.11(GND) U5.4(GND) U6.1(GND) ; port GND
GND-ISO: C31.1 R44.1 U6.3(-VO) ; port GND-ISO
PACK_N: C18.1 D4.1(A) D4.2(A) J9.1 J10.1 ; port PACK_N
VDD_20V: C25.2 R33.2 R35.2 U4.1(VDD)
C1: CON4.4 R2.1
C2: CON4.3 R3.1
C3: CON4.2 R4.1
CC1: J6.A5(CC1) U4.7(CC1)
CC2: J6.B5(CC2) U4.6(CC2)
CFG1: R34.1 U4.9(CFG1) ; port CFG1
CFG2: U4.2(CFG2) ; port CFG2
CFG3: U4.3(CFG3) ; port CFG3
CH_D_N: R36.2 R38.2 U4.5(DM)
CH_D_P: R37.2 R38.1 U4.4(DP)
D_N: D10.2(A) J6.A7(D-) J6.B7(D-) R36.1
D_P: D11.2(A) J6.A6(D+) J6.B6(D+) R37.1
REG_OUT: R42.1 ; port REG_OUT
VC0: C19.2 R1.2 ; port VC0
VC1: C3.1 C20.2 R2.2 ; port VC1
VC2: C3.2 C4.1 R3.2 ; port VC2
VC3: C4.2 R4.2 R40.1 ; port VC3
VC4: C6.1 R40.2 ; port VC4
VC5: C6.2 R6.2 ; port VC5
NetC17_1: C17.1 C18.2
NetC26_1: C26.1 L2.1 U5.5(SW)
NetC26_2: C26.2 U5.6(BST)
NetC30_2: C30.2 R43.1 U6.2(VIN)
NetD9_1: D9.1(A) D9.2(A) F1.2
NetD12_1: D12.1 R39.1
NetF1_1: F1.1 J6.A4/B9(VBUS) J6.B4/A9(VBUS) R33.1
NetR35_1: R35.1 U4.8(VBUS)
NetR41_1: R41.1 R42.2 U5.2(EN)

Not connected (* = marked no-connect by the designer): CON4 MP1* MP2*; J6 A8(SBU1) B8(SBU2); U4 10(PG)*

### Layout directives
differential pair: D_N, D_P
differential pair; net class D1; differential pair class D1_Lines: CH_D_N, CH_D_P

### Notes on the sheet
- B+
- CELL #1
- C3
- CELL #2
- CHG+
- C2
- OUT+
- CELL #3
- CHG-
- OUT-
- C1
- CELL #4
- B-
- NOTE:
- Bleed Resistor
- File:
- Title:
- Date:
- Page
- Num:
- Total:
- Drawn By: Huzaifa Ali

### Library data of the parts
C3 C4 C6 C19 C20 = GRM155R61E105KA12D: CAP CER 1UF 25V X5R 0402; Manufacturer: Murata; Material: Ceramic; Tolerance: 10%; Supplier 1: Digi-Key; Manufacturer Part Number: GRM155R61E105KA12D; Stock 1: 1150750; Pricing 1: 1=0.11, 10=0.077, 100=0.0363, 500=0.02546, 1000=0.02108, 2500=0.01962, 5000=0.01795 (USD); Mount: Surface Mount; Case/Package: 0402; Case Code (Metric): 1005; Case Code (Imperial): 0402; Min Operating Temperature: -55°C; Max Operating Temperature: 85°C; Package Quantity: 10000; Packaging: Tape and Reel; Capacitance: 1uF; Voltage Rating: 25V; Dielectric: X5R; Voltage: 25V; Length: 1mm; Height: 0.5mm; Width: 0.5mm; Thickness: 0.022inch; Depth: 0.5mm; Lead Free: Lead Free; ComponentLink1URL: http://www.farnell.com/datasheets/2048341.pdf?src-supplier=Element14; ComponentLink1Description: http://www.farnell.com/datasheets/2048341.pdf?src-supplier=Element14; Supplier Part Number 1: 490-10017-6-ND; Weight: 0.000212oz; Termination: SMD/SMT; Voltage Rating (DC): 25V; REACH SVHC: No SVHC; LCSC Part Number: C77009
C17 C18 = CL10B104KB8NNNL: CAP CER 0.1UF 50V X7R 0603; Manufacturer: Samsung; Capacitance: 100nF; Tolerance: 10%; Item Type: Capacitor; Supplier 1: Digi-Key; Manufacturer Part Number: CL10B104KB8NNNL; Stock 1: 3731229; Pricing 1: 1=0.1, 10=0.03, 50=0.0164, 100=0.0134, 500=0.00958, 1000=0.00753, 2500=0.00684, 5000=0.0063 (USD); Mount: Surface Mount; Case/Package: 0603; Min Operating Temperature: -55°C; Max Operating Temperature: 125°C; Dielectric: X7R; Packaging: Tape and Reel; Package Quantity: 15000; Voltage Rating: 50V; Voltage Rating (DC): 50V; Series: CL; Construction: Flat; Length: 1.6mm; Width: 0.031inch; Height: 0.8mm; Thickness: 0.035inch; Depth: 0.8mm; Radiation Hardening: No; RoHS Compliant: Yes; ComponentLink1URL: https://www.verical.com/server-webapp/html/getDatasheet?partID=357523&src-supplier=Verical; ComponentLink1Description: https://www.verical.com/server-webapp/html/getDatasheet?partID=357523&src-supplier=Verical; ComponentLink2URL: https://media.digikey.com/pdf/Data%20Sheets/Samsung%20PDFs/CL_Series_MLCC_ds.pdf?src-supplier=Digi-Key; ComponentLink2Description: https://media.digikey.com/pdf/Data%20Sheets/Samsung%20PDFs/CL_Series_MLCC_ds.pdf?src-supplier=Digi-Key; Supplier Part Number 1: 1276-CL10B104KB8NNNLCT-ND; LCSC Part Number: C913912
C25 = 08055C105KAT2A: CAP CER 1UF 50V X7R 0805; Manufacturer: Kyocera AVX; Item Type: Capacitors; Material: Ceramic; Tolerance: 10%; Supplier: Rs; LCSC Part Number: C2167382; Manufacturer Part Number: 08055C105KAT2A; RoHS: Yes; Stock: 6530; Pricing: 10=1.518, 50=1.406, 100=1.309, 250=1.137, 500=0.98 (DKK); Mounting Technology: Surface Mount; Case/Package: 0805; Case Code (Metric): 2012; Case Code (Imperial): 0805; Min Operating Temperature: -55°C; Max Operating Temperature: 125°C; Value: 1uF; Dielectric: X7R; Termination: SMD/SMT; Voltage: 50V; Packaging: Tape and Reel; Voltage Rating: 50V; Package Quantity: 1; Series: -; Length: 2.01mm; Width: 0.049inch; Depth: 1.25mm; Thickness: 0.037inch; Reach SVHC Compliant: No; Lead Free: Lead Free; RoHS Compliant: Yes; ComponentLink1URL: https://datasheet.ciiva.com/25613/0900766b810a29b7-25613127.pdf?src-supplier=Rs; ComponentLink1Description: https://datasheet.ciiva.com/25613/0900766b810a29b7-25613127.pdf?src-supplier=Rs; ComponentLink2URL: https://datasheet.ciiva.com/6268/cx7r-6268826.pdf?src-supplier=Digikey; ComponentLink2Description: https://datasheet.ciiva.com/6268/cx7r-6268826.pdf?src-supplier=Digikey; ComponentLink3URL: https://datasheet.ciiva.com/7812/cx7r-7812085.pdf?src-supplier=Element14; ComponentLink3Description: https://datasheet.ciiva.com/7812/cx7r-7812085.pdf?src-supplier=Element14; ComponentLink4URL: https://datasheet.ciiva.com/22706/1679506-22706999.pdf?src-supplier=Element14; ComponentLink4Description: https://datasheet.ciiva.com/22706/1679506-22706999.pdf?src-supplier=Element14; ComponentLink5URL: https://datasheet.ciiva.com/46385/1818074-46385893.pdf?src-supplier=Element14; ComponentLink5Description: https://datasheet.ciiva.com/46385/1818074-46385893.pdf?src-supplier=Element14; ComponentLink6URL: https://datasheet.ciiva.com/14887/cx7r-14887080.pdf?src-supplier=Digikey; ComponentLink6Description: https://datasheet.ciiva.com/14887/cx7r-14887080.pdf?src-supplier=Digikey; ComponentLink7URL: https://datasheet.ciiva.com/14887/cx7r-14887081.pdf?src-supplier=Digikey; ComponentLink7Description: https://datasheet.ciiva.com/14887/cx7r-14887081.pdf?src-supplier=Digikey
C26 = CC0603KRX7R0BB104: CAP CER 0.1UF 100V X7R 0603; Manufacturer: Yageo; Capacitance: 100nF; Tolerance: 10%; Item Type: Capacitor; Supplier 1: Digi-Key; Manufacturer Part Number: CC0603KRX7R0BB104; RoHS: Yes; Category: Ceramic Capacitors; Stock 1: 60476; Pricing 1: 1=0.19000, 10=0.13500, 50=0.07680, 100=0.06370, 500=0.04466, 1000=0.03696 (USD); Mount: Surface Mount; Case/Package: 0603; Case Code (Metric): 1608; Case Code (Imperial): 0603; Weight: 7.1E-05oz; Min Operating Temperature: -55°C; Max Operating Temperature: 125°C; Package Quantity: 4000; Voltage Rating: 100V; Packaging: Tape and Reel; Dielectric: X7R; Termination: SMD/SMT; Resistor Type: Ceramic; Voltage Rating (DC): 100V; Series: CC; Length: 0.063inch; Width: 0.031inch; Thickness: 0.035inch; Depth: 0.8mm; Lead Free: Lead Free; RoHS Compliant: Yes; ComponentLink1URL: https://datasheet.ciiva.com/6277/mlccorderingcode-6277030.pdf?src-supplier=Digi-Key; ComponentLink1Description: https://datasheet.ciiva.com/6277/mlccorderingcode-6277030.pdf?src-supplier=Digi-Key; ComponentLink2URL: https://datasheet.ciiva.com/6277/mlccorderingcode-6277081.pdf?src-supplier=Digi-Key; ComponentLink2Description: https://datasheet.ciiva.com/6277/mlccorderingcode-6277081.pdf?src-supplier=Digi-Key; ComponentLink3URL: https://datasheet.ciiva.com/6277/mlccorderingcode-6277082.pdf?src-supplier=Digi-Key; ComponentLink3Description: https://datasheet.ciiva.com/6277/mlccorderingcode-6277082.pdf?src-supplier=Digi-Key; Supplier Part Number 1: 311-1523-1-ND; LCSC Part Number: C113803
C27 C30 C31 = CC1210KKX7R9BB106: CAP CER 10UF 50V X7R 1210; Manufacturer: Yageo; Item Type: Capacitors; Tolerance: 10%; Supplier: Farnell; LCSC Part Number: C596319; Manufacturer Part Number: CC1210KKX7R9BB106; RoHS: Yes; Stock: 76; Mounting Technology: Surface Mount; Case/Package: 1210; Case Code (Metric): 3225; Case Code (Imperial): 1210; Min Operating Temperature: -55°C; Max Operating Temperature: 125°C; Value: 10uF; Dielectric: X7R; Packaging: Cut Tape; Voltage Rating: 50V; Voltage Rating (DC): 50V; Series: CC; Length: 0.126inch; Width: 0.098inch; Thickness: 0.11inch; Lead Free: Lead Free; Halogen Free: Halogen Free; RoHS Compliant: Yes; ComponentLink1URL: https://datasheet.octopart.com/CC1210KKX7R9BB106-Yageo-datasheet-147453679.pdf?src-supplier=Newark; ComponentLink1Description: https://datasheet.octopart.com/CC1210KKX7R9BB106-Yageo-datasheet-147453679.pdf?src-supplier=Newark; ComponentLink2URL: https://datasheet.octopart.com/CC1210KKX7R9BB106-Yageo-datasheet-166511530.pdf?src-supplier=Future+Electronics; ComponentLink2Description: https://datasheet.octopart.com/CC1210KKX7R9BB106-Yageo-datasheet-166511530.pdf?src-supplier=Future+Electronics; ComponentLink3URL: http://www.yageo.com/documents/recent/UPY-GPHC_X7R_6.3V-to-50V_18.pdf?src-supplier=Digikey; ComponentLink3Description: http://www.yageo.com/documents/recent/UPY-GPHC_X7R_6.3V-to-50V_18.pdf?src-supplier=Digikey; ComponentLink4URL: http://www.yageo.com/exep/pages/download/literatures/ProductSelectionGuide%202014_Final_2.pdf?src-supplier=Digikey; ComponentLink4Description: http://www.yageo.com/exep/pages/download/literatures/ProductSelectionGuide%202014_Final_2.pdf?src-supplier=Digikey; ComponentLink5URL: https://datasheet.octopart.com/CC1210KKX7R9BB106-Yageo-datasheet-151948686.pdf?src-supplier=Farnell; ComponentLink5Description: https://datasheet.octopart.com/CC1210KKX7R9BB106-Yageo-datasheet-151948686.pdf?src-supplier=Farnell
C28 C29 = CL21A226MOCLRNC: CAP CER 22UF 16V X5R 0805; Manufacturer: Samsung; Tolerance: 20%; Item Type: Capacitor; Supplier 1: Arrow Electronics; Manufacturer Part Number: CL21A226MOCLRNC; RoHS: Yes; Category: Ceramic Capacitors; Stock 1: 10030; Pricing 1: 1=0.29150, 10=0.21440, 25=0.20710, 100=0.12030, 250=0.11910, 500=0.11790, 1000=0.09220, 3000=0.07810, 6000=0.07720, 15000=0.06700 (USD); Mounting Technology: Surface Mount; Case/Package: 0805; Case Code (Metric): 2012; Case Code (Imperial): 0805; Min Operating Temperature: -55°C; Max Operating Temperature: 85°C; Packaging: Tape and Reel; Value: 22uF; Voltage Rating: 16V; Length: 0.079inch; Width: 0.049inch; Thickness: 0.037inch; RoHS Compliant: Yes; ComponentLink1URL: http://www.samsungsem.com/kr/support/product-search/mlcc/CL21A226MOCLRNC.jsp?src-supplier=Digi-Key; ComponentLink1Description: http://www.samsungsem.com/kr/support/product-search/mlcc/CL21A226MOCLRNC.jsp?src-supplier=Digi-Key; Supplier Part Number 1: CL21A226MOCLRNC; LCSC Part Number: C398815
CON4 = S4B-ZR-SM4A-TF(LF)(SN): CONN HEADER SMD R/A 4POS 1.5MM; Manufacturer: JST; Item Type: Wire To Board Connector; Supplier: Arrow Electronics; Supplier Part Number: S4B-ZR-SM4A-TF(LF)(SN); Manufacturer Part Number: S4B-ZR-SM4A-TF(LF)(SN); RoHS: Yes; Category: Headers and Wire Housings; Stock: 115000; Pricing: 1000=0.3597, 2000=0.3278, 5000=0.3171, 10000=0.2956, 25000=0.2849, 50000=0.2848 (USD); ComponentLink1URL: https://datasheet.ciiva.com/25618/0900766b81147f94-25618478.pdf?src-supplier=Rs; ComponentLink1Description: https://datasheet.ciiva.com/25618/0900766b81147f94-25618478.pdf?src-supplier=Rs; ComponentLink2URL: https://datasheet.ciiva.com/26894/getdatasheetpartid-646289-26894627.pdf?src-supplier=Verical; ComponentLink2Description: https://datasheet.ciiva.com/26894/getdatasheetpartid-646289-26894627.pdf?src-supplier=Verical; ComponentLink3URL: https://datasheet.ciiva.com/26894/getdatasheetpartid-558977-26894928.pdf?src-supplier=Verical; ComponentLink3Description: https://datasheet.ciiva.com/26894/getdatasheetpartid-558977-26894928.pdf?src-supplier=Verical; ComponentLink4URL: https://datasheet.ciiva.com/6832/ezh-6832478.pdf?src-supplier=Digi-Key; ComponentLink4Description: https://datasheet.ciiva.com/6832/ezh-6832478.pdf?src-supplier=Digi-Key; LCSC Part Number: C485354
D3 = SMBJ24A: SMB(DO-214AA); Manufacturer: SMC; Item Type: TVS Diode; Manufacturer Part Number: SMBJ24A; Package: SMB(DO-214AA); LCSC Part Number: C493201
D4 = SB10100L: TO-277 Schottky Barrier Diodes (SBD) ROHS; Manufacturer: TWGMC; Item type: Diode; Manufacturer Part Number: SB10100L; Package: TO-277; ComponentLink1Description: LCSC; ComponentLink1URL: https://www.lcsc.com/product-detail/Schottky-Barrier-Diodes-SBD_TWGMC-SB10100L_C5240369.html; LCSC Part Number: C5240369
D9 = PDS760-13: DIODE SCHOTTKY 60V 7A POWERDI5; Manufacturer: Diodes; Supplier: Future Electronics; Supplier Part Number: 7738990; Manufacturer Part Number: PDS760-13; RoHS: No; Category: Rectifier Diodes; Stock: 295000; Pricing: 5000=0.31, 10000=0.305, 15000=0.3, 20000=0.3 (USD); Reverse Voltage: 60V; ComponentLink1URL: https://datasheet.ciiva.com/4715/ds30477-62081-4715698.pdf?src-supplier=Mouser; ComponentLink1Description: https://datasheet.ciiva.com/4715/ds30477-62081-4715698.pdf?src-supplier=Mouser; ComponentLink2URL: https://datasheet.ciiva.com/915/ds30477-915170.pdf?src-supplier=Digikey; ComponentLink2Description: https://datasheet.ciiva.com/915/ds30477-915170.pdf?src-supplier=Digikey; ComponentLink3URL: https://datasheet.ciiva.com/16475/ds30477-16475660.pdf?src-supplier=Future+Electronics; ComponentLink3Description: https://datasheet.ciiva.com/16475/ds30477-16475660.pdf?src-supplier=Future+Electronics; ComponentLink4URL: https://datasheet.ciiva.com/7964/ds30477-7964294.pdf?src-supplier=Element14; ComponentLink4Description: https://datasheet.ciiva.com/7964/ds30477-7964294.pdf?src-supplier=Element14; ComponentLink5URL: https://datasheet.ciiva.com/8301/ds30477-8301047.pdf?src-supplier=Avnet; ComponentLink5Description: https://datasheet.ciiva.com/8301/ds30477-8301047.pdf?src-supplier=Avnet; ComponentLink6URL: https://datasheet.ciiva.com/8301/ds30477-8301849.pdf?src-supplier=Avnet; ComponentLink6Description: https://datasheet.ciiva.com/8301/ds30477-8301849.pdf?src-supplier=Avnet; ComponentLink7URL: https://datasheet.ciiva.com/915/ds30477-915171.pdf?src-supplier=Digikey; ComponentLink7Description: https://datasheet.ciiva.com/915/ds30477-915171.pdf?src-supplier=Digikey; ComponentLink8URL: https://datasheet.ciiva.com/915/ds30477-915172.pdf?src-supplier=Digikey; ComponentLink8Description: https://datasheet.ciiva.com/915/ds30477-915172.pdf?src-supplier=Digikey; LCSC Part Number: C96113; Item Type: Diode
D10 D11 = ESD5B5.0ST1G: TVS DIODE 5VWM SOD523; Manufacturer: ON Semiconductor; Item Type: ESD Protection Device; Supplier: Future Electronics; Supplier Part Number: 1159725; Manufacturer Part Number: ESD5B5.0ST1G; RoHS: Yes; Category: ESD and Circuit Protection ICs; Stock: 486000; Pricing: 3000=0.0396, 9000=0.0381, 15000=0.0375, 60000=0.0357, 90000=0.0346 (USD); ComponentLink1URL: https://datasheet.ciiva.com/339/esd5b5-0st1g-339772.pdf?src-supplier=Avnet; ComponentLink1Description: https://datasheet.ciiva.com/339/esd5b5-0st1g-339772.pdf?src-supplier=Avnet; ComponentLink2URL: https://datasheet.ciiva.com/339/esd5b5-0st1g-339772.pdf?src-supplier=Digi-Key; ComponentLink2Description: https://datasheet.ciiva.com/339/esd5b5-0st1g-339772.pdf?src-supplier=Digi-Key; ComponentLink3URL: https://datasheet.ciiva.com/22637/716649-22637178.pdf?src-supplier=Element14; ComponentLink3Description: https://datasheet.ciiva.com/22637/716649-22637178.pdf?src-supplier=Element14; ComponentLink4URL: https://datasheet.ciiva.com/4510/esd5b5-0st1g-241623-4510548.pdf?src-supplier=Mouser; ComponentLink4Description: https://datasheet.ciiva.com/4510/esd5b5-0st1g-241623-4510548.pdf?src-supplier=Mouser; ComponentLink5URL: https://datasheet.ciiva.com/339/esd5b5-0st1-d-339773.pdf?src-supplier=Digi-Key; ComponentLink5Description: https://datasheet.ciiva.com/339/esd5b5-0st1-d-339773.pdf?src-supplier=Digi-Key; ComponentLink6URL: https://datasheet.ciiva.com/339/esd5b5-0st1-d-339774.pdf?src-supplier=Digi-Key; ComponentLink6Description: https://datasheet.ciiva.com/339/esd5b5-0st1-d-339774.pdf?src-supplier=Digi-Key; LCSC Part Number: C93623
D12 = QBLP617-IB: as D5 on sheet BMS-Controller-Sheet; Supplier: Arrow Electronics; Supplier Part Number: QBLP617-IB; Manufacturer Part Number: QBLP617-IB; RoHS: Compliant; Stock: 1867; Pricing: 1=0.0007 (USD); Case/Package: 0602; Color: Blue; Height: 600µm; Max Operating Temperature: 80°C; Min Operating Temperature: -40°C; Mounting Technology: Surface Mount; Number of Terminals: 2; REACH SVHC: Yes; Schedule B: 8541402000, 8541402000|8541402000|8541402000|8541402000|8541402000, 8541410000; Terminal Pitch: 2.1mm; ComponentLink1URL: https://datasheet.octopart.com:443/QBLP617-IB-QT-Brightek-datasheet-140961254.pdf?src-supplier=IHS; ComponentLink1Description: https://datasheet.octopart.com:443/QBLP617-IB-QT-Brightek-datasheet-140961254.pdf?src-supplier=IHS
F1 = 0458005.DR: FUSE BRD MNT 5A 32VAC 75VDC 1206; Manufacturer: Littelfuse; Supplier: Rs; Supplier Part Number: 1740294; Manufacturer Part Number: 0458005.DR; RoHS: Yes; Category: Fuses; Stock: 1005; Pricing: 1=0.6241, 10=0.73892, 25=0.71895, 50=0.70003 (GBP); ComponentLink1URL: https://datasheet.ciiva.com/1730/337915-1730547.pdf?src-supplier=Newark; ComponentLink1Description: https://datasheet.ciiva.com/1730/337915-1730547.pdf?src-supplier=Newark; ComponentLink2URL: https://datasheet.ciiva.com/7991/337915-7991910.pdf?src-supplier=Element14; ComponentLink2Description: https://datasheet.ciiva.com/7991/337915-7991910.pdf?src-supplier=Element14; ComponentLink3URL: https://datasheet.ciiva.com/299/littelfuse-fuse-458-series-299786.pdf?src-supplier=Digikey; ComponentLink3Description: https://datasheet.ciiva.com/299/littelfuse-fuse-458-series-299786.pdf?src-supplier=Digikey; ComponentLink4URL: https://datasheet.ciiva.com/299/littelfuse-fuse-458-series-299787.pdf?src-supplier=Digikey; ComponentLink4Description: https://datasheet.ciiva.com/299/littelfuse-fuse-458-series-299787.pdf?src-supplier=Digikey; ComponentLink5URL: https://datasheet.ciiva.com/299/littelfuse-fuse-458-series-299788.pdf?src-supplier=Digikey; ComponentLink5Description: https://datasheet.ciiva.com/299/littelfuse-fuse-458-series-299788.pdf?src-supplier=Digikey; LCSC Part Number: C187561; Item Type: Fuse
J1 J2 J7-J10 = Through_Hole_Pad: Wire Connecting Pad
J6 = TYPE-C-31-M-12: 5A 1 16P Female Type-C SMD USB Connectors ROHS; Manufacturer: Korean Hroparts Elec; ComponentLink1Description: LCSC; ComponentLink1URL: https://www.lcsc.com/product-detail/USB-Connectors_Korean-Hroparts-Elec-TYPE-C-31-M-12_C165948.html; Manufacturer Part Number: TYPE-C-31-M-12; Footprint: Custom; LCSC Part Number: C165948; Item Type: USB Connector
L2 = FNR4030S3R9MT: 2.3A 3.9uH ±20% 3.3A SMD,4x4mm Power Inductors ROHS; Manufacturer: cjiang; Manufacturer Part Number: FNR4030S3R9MT; Footprint: Custom; ComponentLink1Description: LCSC; ComponentLink1URL: https://www.lcsc.com/product-detail/Power-Inductors_cjiang-Changjiang-Microelectronics-Tech-FNR4030S3R9MT_C167872.html; LCSC Part Number: C167872; Item Type: Inductor
R1-R4 R6 = AC0805FR-07100RL: RES SMD 100 OHM 1% 1/8W 0805; Manufacturer: Yageo; Item Type: Resistor; Supplier: Future Electronics; Supplier Part Number: 6087312; Manufacturer Part Number: AC0805FR-07100RL; RoHS: Yes; Category: Chip SMD Resistors; Stock: 70000; Pricing: 5000=0.0032, 25000=0.003, 125000=0.0028, 375000=0.0027, 1000000=0.0025 (USD); ComponentLink1URL: https://datasheet.ciiva.com/12656/pyu-ac-51-rohs-l-2-12656967.pdf?src-supplier=Mouser; ComponentLink1Description: https://datasheet.ciiva.com/12656/pyu-ac-51-rohs-l-2-12656967.pdf?src-supplier=Mouser; LCSC Part Number: C138274
R33 = RC0603FR-071KL: RES SMD 1K OHM 1% 1/10W 0603; Manufacturer: Yageo; Resistance: 1kR; Temperature Coefficient: 100ppm/°C; Power Rating: 100mW; Voltage Rating: 50V; Item type: Resistor; ComponentLink1URL: https://www.verical.com/server-webapp/html/getDatasheet?partID=409289&src-supplier=Verical; ComponentLink1Description: https://www.verical.com/server-webapp/html/getDatasheet?partID=409289&src-supplier=Verical; Supplier 1: Digi-Key; Manufacturer Part Number: RC0603FR-071KL; Stock 1: 21472395; Pricing 1: 1=0.1, 10=0.023, 100=0.0094, 1000=0.0042, 2500=0.0037 (USD); Case/Package: 0603; Contact Plating: Tin,Matte; Case Code (Imperial): 0603; Case Code (Metric): 1608; Min Operating Temperature: -55°C; Max Operating Temperature: 155°C; Tolerance: 1%; Composition: Thick Film; Packaging: Tape and Reel; Termination: SMD/SMT; Military Standard: Not; Length: 1.6mm; Height: 0.45mm; Depth: 0.8mm; Radiation Hardening: No; REACH SVHC: No SVHC; Lead Free: Lead Free; ComponentLink2URL: http://documents.rs-components.com/techlib://itc_doclist_GB.htm?stockno=5048928&src-supplier=RSComponents; ComponentLink2Description: http://documents.rs-components.com/techlib://itc_doclist_GB.htm?stockno=5048928&src-supplier=RSComponents; ComponentLink3URL: http://www.yageo.com/documents/recent/PYu-RC0603_51_RoHS_L_4.pdf?src-supplier=Avnet+Europe; ComponentLink3Description: http://www.yageo.com/documents/recent/PYu-RC0603_51_RoHS_L_4.pdf?src-supplier=Avnet+Europe; ComponentLink4URL: http://www.farnell.com/datasheets/2167052.pdf?src-supplier=Element14; ComponentLink4Description: http://www.farnell.com/datasheets/2167052.pdf?src-supplier=Element14; ComponentLink5URL: http://www.farnell.com/datasheets/1868787.pdf?src-supplier=Element14; ComponentLink5Description: http://www.farnell.com/datasheets/1868787.pdf?src-supplier=Element14; ComponentLink6URL: http://www.yageo.com/documents/recent/PYu-RC_Group_51_RoHS_L_2.pdf?src-supplier=Avnet; ComponentLink6Description: http://www.yageo.com/documents/recent/PYu-RC_Group_51_RoHS_L_2.pdf?src-supplier=Avnet; ComponentLink7URL: https://www.verical.com/server-webapp/html/getDatasheet?partID=404327&src-supplier=Verical; ComponentLink7Description: https://www.verical.com/server-webapp/html/getDatasheet?partID=404327&src-supplier=Verical; ComponentLink8URL: http://www.farnell.com/datasheets/443971.pdf?src-supplier=Element14; ComponentLink8Description: http://www.farnell.com/datasheets/443971.pdf?src-supplier=Element14; Supplier Part Number 1: 311-1.00KHRDKR-ND; LCSC Part Number: C22548
R34 R35 R39 = RC0603FR-0710KL: RES SMD 10K Ohm 1% 1/10W 0603; Manufacturer: Yageo; Resistance: 10kR; Temperature Coefficient: 100ppm/°C; Voltage Rating (DC): 50V; Power Rating: 100mW; Voltage Rating: 75V; Item Type: Resistor; Supplier 1: Digi-Key; Manufacturer Part Number: RC0603FR-0710KL; RoHS: Yes; Category: Chip SMD Resistors; Stock 1: 25249139; Pricing 1: 1=0.10000, 10=0.02400, 100=0.00970, 1000=0.00436, 2500=0.00378 (USD); Case/Package: 0603; Number of Pins: 2; Case Code (Imperial): 0603; Case Code (Metric): 1608; Weight: 7.1E-05oz; Size Code: 0603; Min Operating Temperature: -55°C; Max Operating Temperature: 155°C; Tolerance: 1%; Resistor Type: Thick Film; Packaging: Tape and Reel; Termination: SMD/SMT; Features: Moisture Resistant; Series: RC; Max Power Dissipation: 100mW; Number of Terminations: 2; Resistance Tolerance: 1%; Construction: Rectangular; Length: 1.6mm; Width: 0.8mm; Height: 0.45mm; Depth: 0.8mm; Lead Pitch: 0.3mm; REACH SVHC: Unknown; Lead Free: Lead Free; Military Standard: Not; RoHS Compliant: Yes; ComponentLink1URL: https://datasheet.ciiva.com/7660/38590-7660789.pdf?src-supplier=Element14; ComponentLink1Description: https://datasheet.ciiva.com/7660/38590-7660789.pdf?src-supplier=Element14; ComponentLink2URL: https://datasheet.ciiva.com/7983/443971-7983596.pdf?src-supplier=Element14; ComponentLink2Description: https://datasheet.ciiva.com/7983/443971-7983596.pdf?src-supplier=Element14; ComponentLink3URL: https://datasheet.ciiva.com/22747/443971-22747519.pdf?src-supplier=Element14; ComponentLink3Description: https://datasheet.ciiva.com/22747/443971-22747519.pdf?src-supplier=Element14; ComponentLink4URL: https://datasheet.ciiva.com/46440/1868787-46440891.pdf?src-supplier=Element14; ComponentLink4Description: https://datasheet.ciiva.com/46440/1868787-46440891.pdf?src-supplier=Element14; ComponentLink5URL: https://datasheet.ciiva.com/7746/1738695-7746239.pdf?src-supplier=Element14; ComponentLink5Description: https://datasheet.ciiva.com/7746/1738695-7746239.pdf?src-supplier=Element14; ComponentLink6URL: https://datasheet.ciiva.com/15189/getdatasheetpartid-409289-15189591.pdf?src-supplier=Verical; ComponentLink6Description: https://datasheet.ciiva.com/15189/getdatasheetpartid-409289-15189591.pdf?src-supplier=Verical; Supplier Part Number 1: 311-10.0KHRCT-ND; LCSC Part Number: C98220
R36-R38 R40-R43 = RC0603JR-070RL: as R45 on sheet BMS-Controller-Sheet; Supplier 1: Digi-Key; Manufacturer Part Number: RC0603JR-070RL; RoHS: Yes; Category: Chip SMD Resistors; Stock 1: 18081776; Pricing 1: 1=0.10000, 10=0.01700, 25=0.01240, 50=0.00960, 100=0.00700, 250=0.00536, 500=0.00430, 1000=0.00316 (USD); Case/Package: 0603; Number of Pins: 2; Contact Plating: Tin,Matte; Case Code (Imperial): 0603; Case Code (Metric): 1608; Size Code: 0603; Min Operating Temperature: -55°C; Max Operating Temperature: 155°C; Resistor Type: Thick Film; Packaging: Tape and Reel; Termination: SMD/SMT; Series: RC; Technology: THICK FILM; Package Quantity: 5000; Voltage Rating: 50V; Features: Moisture Resistant; Max Power Dissipation: 100mW; Number of Terminations: 2; Construction: Rectangular; Length: 1.6mm; Width: 0.8mm; Height: 0.45mm; Depth: 0.8mm; Radiation Hardening: No; Reach SVHC Compliant: No SVHC; Lead Free: Lead Free; RoHS Compliant: Yes; Military Standard: Not; Supplier Part Number 1: 311-0.0GRCT-ND; LCSC Part Number: C95177
R44 = RK73H1ETTP3300F: RES 330 OHM 1% 1/10W 0402; Manufacturer: KOA Speer; Power Rating: 63mW; Voltage Rating: 50V; Temperature Coefficient: 100ppm/°C; Max Power Dissipation: 100mW; Supplier: Rs; Supplier Part Number: 6317972; Manufacturer Part Number: RK73H1ETTP3300F; RoHS: Yes; Category: Chip SMD Resistors; Stock: 36500; Pricing: 100=0.007, 1000=0.006, 2500=0.006, 5000=0.006, 10000=0.005 (GBP); Case/Package: 0402; Case Code (Imperial): 0402; Case Code (Metric): 1005; Min Operating Temperature: -55°C; Max Operating Temperature: 155°C; Value: 330R; Tolerance: 1%; Packaging: Tape and Reel; Package Quantity: 10000; Termination: SMD/SMT; Voltage Rating (DC): 50V; Series: RK73H; Construction: Rectangular; Features: Moisture Resistant,Automotive AEC-Q200; Number of Terminations: 2; Length: 1mm; Width: 0.5mm; Height: 0.35mm; LCSC Part Number: C159971; Ratings: AEC-Q200; Military Standard: Not; Lead Free: Lead Free; RoHS Compliant: Yes; ComponentLink1URL: https://datasheet.ciiva.com/5555/rk73h-5555909.pdf?src-supplier=Mouser; ComponentLink1Description: https://datasheet.ciiva.com/5555/rk73h-5555909.pdf?src-supplier=Mouser; ComponentLink2URL: https://datasheet.ciiva.com/15203/getdatasheetpartid-424481-15203100.pdf?src-supplier=Verical; ComponentLink2Description: https://datasheet.ciiva.com/15203/getdatasheetpartid-424481-15203100.pdf?src-supplier=Verical
U4 = CH224K: ESSOP-10-150mil-1mm USB PD ROHS; Manufacturer: WCH; Item Type: IC; Manufacturer Part Number: CH224K; Package: ESSOP-10-150mil-1mm; LCSC Part Number: C970725; ComponentLink1Description: LCSC; ComponentLink1URL: https://www.lcsc.com/product-detail/USB-PD_WCH-Jiangsu-Qin-Heng-CH224K_C970725.html
U5 = AP63203WU-7: IC REG BUCK 3.3V 2A TSOT26; Manufacturer: Diodes; Supplier: Future Electronics; Supplier Part Number: 6109504; Manufacturer Part Number: AP63203WU-7; RoHS: Yes; Category: Voltage Regulators - Switching; Stock: 3000; Pricing: 3000=0.34, 6000=0.335, 9000=0.33, 12000=0.33, 15000=0.32 (USD); ComponentLink1URL: https://www.diodes.com/assets/Datasheets/AP63200-AP63201-AP63203-AP63205.pdf?src-supplier=Digi-Key; ComponentLink1Description: https://www.diodes.com/assets/Datasheets/AP63200-AP63201-AP63203-AP63205.pdf?src-supplier=Digi-Key; LCSC Part Number: C780769; Item Type: IC
U6 = B0303S-1WR2: Plugin Isolated Power Modules ROHS; Manufacturer: YLPTEC; Manufacturer Part Number: B0303S-1WR2; Package: Plugin; LCSC Part Number: C2992399; Item Type: Power Module; ComponentLink1Description: LCSC; ComponentLink1URL: https://www.lcsc.com/product-detail/Isolated-Power-Modules_YLPTEC-B0303S-1WR2_C2992399.html